# Altium schematic sheet MCU.SchDoc
size 420 x 297 mm; SheetNumber: 2; SheetTotal: 5
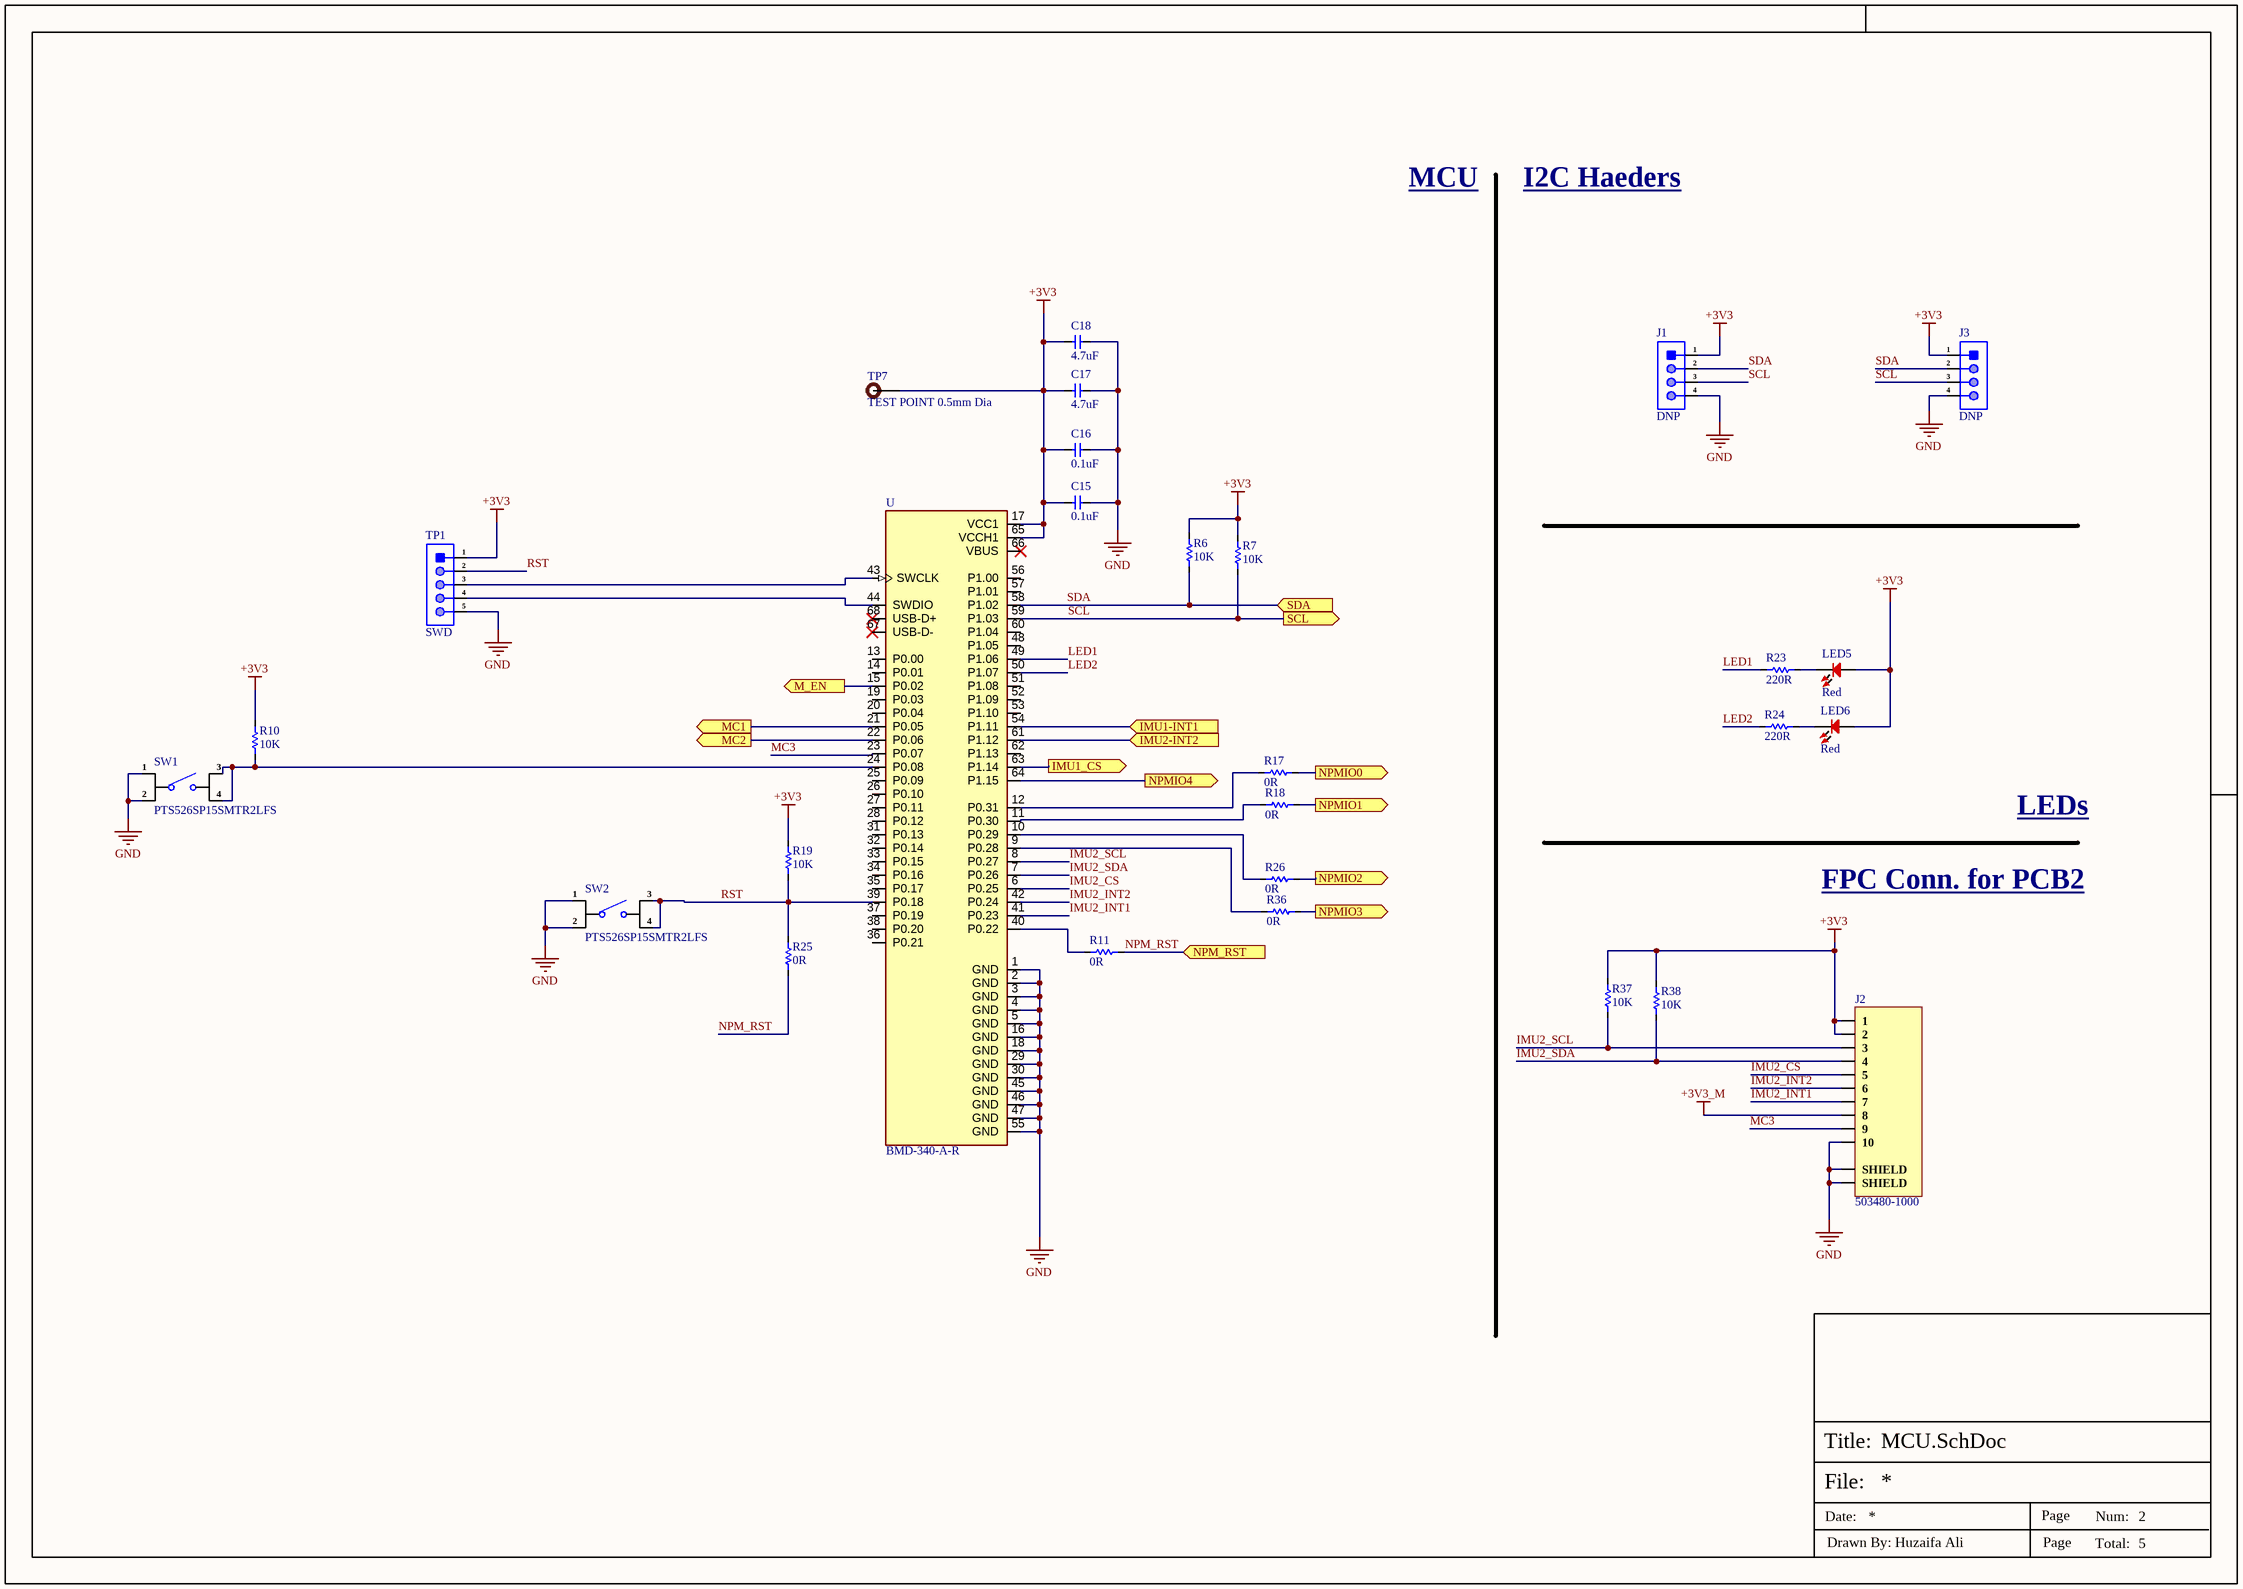
[diagram p0: MCU.SchDoc]

## Parts
C15  0.1uF  [Cap-0402]
C16  0.1uF  [Cap-0402]
C17  4.7uF  [Cap-0402]
C18  4.7uF  [Cap-0402]
J1  DNP  [4P Through Hole Pads]
J2  503480-1000  [5034801000]
J3  DNP  [4P Through Hole Pads]
LED5  Red  [LED-0402]
LED6  Red  [LED-0402]
R6  10K  [Res-0402]
R7  10K  [Res-0402]
R10  10K  [Res-0402]
R11  0R  [Res-0402]
R17  0R  [Res-0402]
R18  0R  [Res-0402]
R19  10K  [Res-0402]
R23  220R  [Res-0402]
R24  220R  [Res-0402]
R25  0R  [Res-0402]
R26  0R  [Res-0402]
R36  0R  [Res-0402]
R37  10K  [Res-0402]
R38  10K  [Res-0402]
SW1  PTS526SP15SMTR2LFS  [PTS526SP15SMTR2 LFS]
SW2  PTS526SP15SMTR2LFS  [PTS526SP15SMTR2 LFS]
TP1  SWD  [5 Test Pad]  (no BOM)
TP7  TEST POINT 0.5mm Dia  [Test-point - 0.5mm]  (no BOM)
U  BMD-340-A-R  [RIGADO_BMD-340-A-R]

## Ports
IMU1-INT1 (in, see IMU[5B]), IMU1_CS (out, see IMU[3C]), IMU2-INT2 (in, see IMU[5B]), M_EN (out, see Power_Management[3A]), MC1 (out, see Motor_Driver[2C]), MC2 (out, see Motor_Driver[4C]), NPM_RST (in, see Power_Management[3C]), NPMIO0 (out, see Power_Management[3C]), NPMIO1 (out, see Power_Management[3C]), NPMIO2 (out, see Power_Management[3C]), NPMIO3 (out, see Power_Management[3C]), NPMIO4 (out, see Power_Management[3C]), SCL (out, see IMU[3C], Power_Management[2D]), SDA (in, see IMU[3C], Power_Management[2D])

## Nets
+3V3: C15.2 C16.2 C17.2 C18.2 J1.1 J2.1 J2.2 J3.1 LED5.1 LED6.1 R6.2 R7.2 R10.2 R19.2 R37.2 R38.2 TP1.1 TP7.1 U.17(VCC1) U.65(VCCH1)
+3V3_M: J2.8
GND: C15.1 C16.1 C17.1 C18.1 J1.4 J2.10 J2.S1(SHIELD) J2.S2(SHIELD) J3.4 SW1.1 SW1.2 SW2.1 SW2.2 TP1.5 U.1(GND) U.2(GND) U.3(GND) U.4(GND) U.5(GND) U.16(GND) U.18(GND) U.29(GND) U.30(GND) U.45(GND) U.46(GND) U.47(GND) U.55(GND)
IMU1-INT1: U.54(P1.11) ; port IMU1-INT1
IMU1_CS: U.63(P1.14) ; port IMU1_CS
IMU2-INT2: U.61(P1.12) ; port IMU2-INT2
IMU2_CS: J2.5 U.6(P0.25)
IMU2_INT1: J2.7 U.41(P0.23)
IMU2_INT2: J2.6 U.42(P0.24)
IMU2_SCL: J2.3 R37.1 U.8(P0.27)
IMU2_SDA: J2.4 R38.1 U.7(P0.26)
LED1: R23.2 U.49(P1.06)
LED2: R24.2 U.50(P1.07)
M_EN: U.15(P0.02) ; port M_EN
MC1: U.21(P0.05) ; port MC1
MC2: U.22(P0.06) ; port MC2
MC3: J2.9 U.23(P0.07)
NPM_RST: R11.2 R25.1 ; port NPM_RST
NPMIO0: R17.2 ; port NPMIO0
NPMIO1: R18.2 ; port NPMIO1
NPMIO2: R26.2 ; port NPMIO2
NPMIO3: R36.2 ; port NPMIO3
NPMIO4: U.64(P1.15) ; port NPMIO4
RST: R19.1 R25.2 SW2.3 SW2.4 TP1.2 U.39(P0.18)
SCL: J1.3 J3.3 R7.1 U.59(P1.03) ; port SCL
SDA: J1.2 J3.2 R6.1 U.58(P1.02) ; port SDA
NetLED5_2: LED5.2 R23.1
NetLED6_2: LED6.2 R24.1
NetR10_1: R10.1 SW1.3 SW1.4 U.24(P0.08)
NetR11_1: R11.1 U.40(P0.22)
NetR17_1: R17.1 U.12(P0.31)
NetR18_1: R18.1 U.11(P0.30)
NetR26_1: R26.1 U.10(P0.29)
NetR36_1: R36.1 U.9(P0.28)
NetTP1_3: TP1.3 U.43(SWCLK)
NetTP1_4: TP1.4 U.44(SWDIO)

Not connected (* = marked no-connect by the designer): U 13(P0.00) 14(P0.01) 19(P0.03) 20(P0.04) 25(P0.09) 26(P0.10) 27(P0.11) 28(P0.12) 31(P0.13) 32(P0.14) 33(P0.15) 34(P0.16) 35(P0.17) 36(P0.21) 37(P0.19) 38(P0.20) 48(P1.05) 51(P1.08) 52(P1.09) 53(P1.10) 56(P1.00) 57(P1.01) 60(P1.04) 62(P1.13) 66(VBUS)* 67(USB-D-)* 68(USB-D+)*

## Notes on the sheet
- MCU
- I2C Haeders
- LEDs
- FPC Conn. for PCB2
- File:
- Title:
- Date:
- Page
- Num:
- Total:
- Drawn By: Huzaifa Ali

## Library data of the parts
C15 C16 = C1005X5R1H104K050BB: CAP CER 0.1UF 50V X5R 0402; Manufacturer: TDK; Dielectric Material: Ceramic; Capacitance: 100nF; Tolerance: 10%; Item Type: Capacitor; Supplier 1: Digi-Key; Manufacturer Part Number: C1005X5R1H104K050BB; Stock 1: 1455182; Pricing 1: 1=0.12, 10=0.09, 50=0.049, 100=0.04, 500=0.02858, 1000=0.02245, 2500=0.02041, 5000=0.01878 (USD); Mount: Surface Mount; Case/Package: 0402; Case Code (Metric): 1005; Case Code (Imperial): 0402; Weight: 2.3E-05oz; Min Operating Temperature: -55°C; Max Operating Temperature: 85°C; Dielectric: X5R; Voltage Rating: 50V; Packaging: Tape and Reel; Voltage Rating (DC): 50V; Termination: SMD/SMT; Construction: Flat; Package Quantity: 1; Resistor Type: Ceramic; Voltage: 50V; Series: C; Length: 1mm; Width: 0.02inch; Height: 0.5mm; Depth: 0.5mm; Thickness: 0.022inch; Radiation Hardening: No; Lead Free: Lead Free; REACH SVHC: No SVHC; RoHS Compliant: Yes; ComponentLink1URL: https://product.tdk.com/info/en/catalog/spec/mlccspec_commercial_general_midvoltage_en.pdf?src-supplier=Digi-Key; ComponentLink1Description: https://product.tdk.com/info/en/catalog/spec/mlccspec_commercial_general_midvoltage_en.pdf?src-supplier=Digi-Key; ComponentLink2URL: http://www.tdk.co.jp/tefe02/e413_c.pdf?src-supplier=Future+Electronics; ComponentLink2Description: http://www.tdk.co.jp/tefe02/e413_c.pdf?src-supplier=Future+Electronics; ComponentLink3URL: https://www.verical.com/server-webapp/html/getDatasheet?partID=743571&src-supplier=Verical; ComponentLink3Description: https://www.verical.com/server-webapp/html/getDatasheet?partID=743571&src-supplier=Verical; ComponentLink4URL: http://www.tdk.co.jp/tefe02/e412_c.pdf?src-supplier=Avnet+Europe; ComponentLink4Description: http://www.tdk.co.jp/tefe02/e412_c.pdf?src-supplier=Avnet+Europe; Supplier Part Number 1: 445-5942-1-ND; LCSC Part Number: C2181865
C17 C18 = CL05A475MO5NUNC: CAP CER 4.7UF 16V X5R 0402; Manufacturer: Samsung; Material: 4241ConductorMaterial; Tolerance: 20%; Supplier 1: Avnet; Manufacturer Part Number: CL05A475MO5NUNC; RoHS: Yes; Category: Ceramic Capacitors; Stock 1: 50000; Pricing 1: 10000=0.09712 (USD); Mount: Surface Mount; Case/Package: 0402; Case Code (Metric): 1005; Case Code (Imperial): 0402; Min Operating Temperature: -55°C; Max Operating Temperature: 85°C; Packaging: Cut Tape; Capacitance: 4.7uF; Voltage Rating: 16V; Series: CL; Voltage Rating (DC): 16V; Length: 0.039inch; Width: 0.02inch; Height: 550um; Thickness: 0.022inch; RoHS Compliant: Yes; ComponentLink1URL: http://www.farnell.com/datasheets/2710653.pdf?src-supplier=Farnell; ComponentLink1Description: http://www.farnell.com/datasheets/2710653.pdf?src-supplier=Farnell; ComponentLink2URL: http://www.samsungsem.com/kr/support/product-search/mlcc/CL05A475MO5NUNC.jsp?src-supplier=Digikey; ComponentLink2Description: http://www.samsungsem.com/kr/support/product-search/mlcc/CL05A475MO5NUNC.jsp?src-supplier=Digikey; ComponentLink3URL: http://www.farnell.com/datasheets/2710653.pdf?src-supplier=Element14; ComponentLink3Description: http://www.farnell.com/datasheets/2710653.pdf?src-supplier=Element14; ComponentLink4URL: https://datasheet.octopart.com/CL05A475MO5NUNC-Samsung-Electro-Mechanics-datasheet-123102911.pdf?src-supplier=Future+Electronics; ComponentLink4Description: https://datasheet.octopart.com/CL05A475MO5NUNC-Samsung-Electro-Mechanics-datasheet-123102911.pdf?src-supplier=Future+Electronics; ComponentLink5URL: http://www.farnell.com/datasheets/2710653.pdf?src-supplier=Newark; ComponentLink5Description: http://www.farnell.com/datasheets/2710653.pdf?src-supplier=Newark; Supplier Part Number 1: CL05A475MO5NUNC
J1 J3 = 4P Through Hole Pads: Wire Connecting Pads; Manufacturer Part Number: 4P Through Hole Pads; Item Type: Through Hole Pads
J2 = 503480-1000: CONN FFC FPC 10POS 0.5MM R/A; Manufacturer: Molex; Item Type: FFC / FPC; Actuator Material: Nylon,Glass,Polyamide; Actuator Color: Black; Plating: 157ConductorMaterial; Voltage Rating (AC): 50V; Current Rating: 500mA; Number of Positions: 10; Gender: Receptacle; Wire/Cable Type: Straight; Stackable: No; Supplier: Mouser; Supplier Part Number: 538-503480-1000; Manufacturer Part Number: 503480-1000; RoHS: Yes; Stock: 11378; Pricing: 1=0.99, 10=0.737, 50=0.737, 100=0.64, 1000=0.559, 10000=0.465 (USD); Housing Color: White; Housing Material: Polymer; Material: 150ConductorMaterial; Contact Material: Bronze; Contact Plating: Gold; Min Operating Temperature: -40°C; Max Operating Temperature: 85°C; Package Quantity: 3000; Number of Rows: 1; Voltage Rating: 50V; Packaging: Tape and Reel; Termination: Solder; Max Voltage Rating (AC): 50V; Number of Contacts: 10; Max Voltage Rating (DC): 50V; Orientation: Right Angle; Series: BackFlip, Easy-On 503480; Number of Circuits: 10; Mating Cycles: 10; Length: 6.7mm; Pitch: 0.5mm; Depth: 3.6mm; Radiation Hardening: No; Flammability Rating: UL94 V-0; Reach SVHC Compliant: Unknown; Halogen Free: 5696HalogenFree; ELV: 5681ELVCompliant; ComponentLink1URL: https://datasheet.ciiva.com/26916/getdatasheetpartid-735332-26916946.pdf?src-supplier=Verical; ComponentLink1Description: https://datasheet.ciiva.com/26916/getdatasheetpartid-735332-26916946.pdf?src-supplier=Verical; ComponentLink2URL: https://datasheet.ciiva.com/5137/5034801000-ffc-fpc-connectors-179433-5137762.pdf?src-supplier=Mouser; ComponentLink2Description: https://datasheet.ciiva.com/5137/5034801000-ffc-fpc-connectors-179433-5137762.pdf?src-supplier=Mouser; ComponentLink3URL: https://datasheet.ciiva.com/671/5034801000-sd-671179.pdf?src-supplier=Digikey; ComponentLink3Description: https://datasheet.ciiva.com/671/5034801000-sd-671179.pdf?src-supplier=Digikey
LED5 LED6 = XZMDK68W-2: LED RED CLEAR CHIP SMD; Manufacturer: SunLED; Lens Color: Colorless; Luminous Intensity: 69mcd; Test Current: 20mA; Viewing Angle: 120°; Dominant Wavelength: 630nm; Forward Voltage: 1.95V; Supplier 1: Digi-Key; Manufacturer Part Number: XZMDK68W-2; Stock 1: 69539; Pricing 1: 1=0.43, 10=0.306, 100=0.136, 500=0.0952, 1000=0.0782 (USD); Mount: Surface Mount; Case/Package: 0402; Color: Red; Case Code (Metric): 1005; Case Code (Imperial): 0402; Packaging: Tape and Reel; Lens Transparency: Clear; Length: 1mm; Height: 0.6mm; Width: 0.5mm; ComponentLink1URL: http://www.sunledusa.com/products/spec/XZMDK68W-2.pdf?src-supplier=Digi-Key; ComponentLink1Description: http://www.sunledusa.com/products/spec/XZMDK68W-2.pdf?src-supplier=Digi-Key; ComponentLink2URL: https://www.sunledusa.com/products/spec/XZMDK68W-2.pdf?src-supplier=Digi-Key; ComponentLink2Description: https://www.sunledusa.com/products/spec/XZMDK68W-2.pdf?src-supplier=Digi-Key; Supplier Part Number 1: 1497-1174-6-ND; Item Type: LED
R6 R7 R10 R19 R37 R38 = RC0402FR-0710KL: RES 10K OHM 1% 1/16W 0402; Manufacturer: Yageo; Resistance: 10kR; Voltage Rating (DC): 50V; Temperature Coefficient: 100ppm/°C; Power Rating: 62.5mW; Max Power Dissipation: 63mW; Item Type: Resistor; Supplier 1: Mouser; Manufacturer Part Number: RC0402FR-0710KL; RoHS: Yes; Category: Chip SMD Resistors; Stock 1: 18648329; Pricing 1: 1=0.10000, 10=0.01400, 50=0.01400, 100=0.00500, 1000=0.00300, 10000=0.00200 (USD); Case/Package: 0402; Number of Pins: 2; Case Code (Imperial): 0402; Case Code (Metric): 1005; Min Operating Temperature: -55°C; Max Operating Temperature: 155°C; Resistor Type: Thick Film; Tolerance: 1%; Packaging: Tape and Reel; Voltage Rating: 50V; Termination: SMD/SMT; Working Voltage: 50V; Number of Terminations: 2; Features: Moisture Resistant; Series: RC; Resistance Tolerance: 1%; Construction: Rectangular; Length: 1mm; Width: 0.5mm; Height: 0.32mm; Depth: 0.5mm; Lead Pitch: 0.2mm; REACH SVHC: No SVHC; Lead Free: Lead Free; RoHS Compliant: Yes; Military Standard: Not; ComponentLink1URL: https://datasheet.ciiva.com/7660/38568-7660787.pdf?src-supplier=Element14; ComponentLink1Description: https://datasheet.ciiva.com/7660/38568-7660787.pdf?src-supplier=Element14; ComponentLink2URL: https://datasheet.ciiva.com/7849/1686128-7849814.pdf?src-supplier=Element14; ComponentLink2Description: https://datasheet.ciiva.com/7849/1686128-7849814.pdf?src-supplier=Element14; ComponentLink3URL: https://datasheet.ciiva.com/7983/1018594-7983486.pdf?src-supplier=Element14; ComponentLink3Description: https://datasheet.ciiva.com/7983/1018594-7983486.pdf?src-supplier=Element14; ComponentLink4URL: https://datasheet.ciiva.com/22747/1018594-22747512.pdf?src-supplier=Element14; ComponentLink4Description: https://datasheet.ciiva.com/22747/1018594-22747512.pdf?src-supplier=Element14; ComponentLink5URL: https://datasheet.ciiva.com/12667/pyu-rc0402-51-rohs-l-6-r-12667067.pdf?src-supplier=Mouser; ComponentLink5Description: https://datasheet.ciiva.com/12667/pyu-rc0402-51-rohs-l-6-r-12667067.pdf?src-supplier=Mouser; ComponentLink6URL: https://datasheet.ciiva.com/7849/1784430-7849813.pdf?src-supplier=Element14; ComponentLink6Description: https://datasheet.ciiva.com/7849/1784430-7849813.pdf?src-supplier=Element14; ComponentLink7URL: https://datasheet.ciiva.com/7849/1784430-7849815.pdf?src-supplier=Element14; ComponentLink7Description: https://datasheet.ciiva.com/7849/1784430-7849815.pdf?src-supplier=Element14; Supplier Part Number 1: 603-RC0402FR-0710KL; LCSC Part Number: C60490
R11 R17 R18 R25 R26 R36 = RC0402FR-070RL: RES 0 OHM JUMPER 1/16W 0402; Manufacturer: Yageo; Item Type: Resistors; Tolerance: 1%; Power Rating: 62.5mW; Voltage Rating: 50V; Temperature Coefficient: 200ppm/°C; Max Power Dissipation: 63mW; Supplier 1: Mouser; Manufacturer Part Number: RC0402FR-070RL; RoHS: Yes; Stock 1: 8556842; Pricing 1: 1=0.10000, 10=0.01400, 50=0.01400, 100=0.00600, 1000=0.00300, 5000=0.00200, 10000=0.00100 (USD); Mount: Surface Mount; Case/Package: 0402; Contact Plating: Tin,Matte; Case Code (Imperial): 0402; Case Code (Metric): 1005; Size Code: 0402; Min Operating Temperature: -55°C; Max Operating Temperature: 155°C; Resistance: 0R; Resistor Type: Thick Film; Packaging: Tape and Reel; Termination: SMD/SMT; Features: Moisture Resistant; Series: RC; Number of Terminations: 2; Length: 1mm; Width: 0.5mm; Height: 0.35mm; Radiation Hardening: No; Lead Free: Lead Free; RoHS Compliant: Yes; ComponentLink1URL: https://datasheet.ciiva.com/8896/pyu-rc0402-51-rohs-l-6-8896149.pdf?src-supplier=Avnet; ComponentLink1Description: https://datasheet.ciiva.com/8896/pyu-rc0402-51-rohs-l-6-8896149.pdf?src-supplier=Avnet; ComponentLink2URL: https://datasheet.ciiva.com/16790/pyu-rc0402-51-rohs-l-6-r-16790444.pdf?src-supplier=Future+Electronics; ComponentLink2Description: https://datasheet.ciiva.com/16790/pyu-rc0402-51-rohs-l-6-r-16790444.pdf?src-supplier=Future+Electronics; Supplier Part Number 1: 603-RC0402FR-070RL; LCSC Part Number: C106231
R23 R24 = RC0402FR-07220RL: RES 220 OHM 1% 1/16W 0402; Manufacturer: Yageo; Item Type: Resistors; Power Rating: 62.5mW; Voltage Rating: 50V; Temperature Coefficient: 100ppm/°C; Max Power Dissipation: 63mW; Supplier: Digikey; LCSC Part Number: C112291; Manufacturer Part Number: RC0402FR-07220RL; RoHS: Yes; Stock: 225544; Pricing: 1=0.1, 10=0.007, 100=0.0061, 1000=0.0051, 2500=0.00408 (USD); Case/Package: 0402; Pins: 2; Case Code (Imperial): 0402; Case Code (Metric): 1005; Min Operating Temperature: -55°C; Max Operating Temperature: 155°C; Value: 220R; Tolerance: 1%; Packaging: Tape and Reel; Voltage Rating (DC): 50V; Package Quantity: 1; Termination: SMD/SMT; Resistor Type: Thick Film; Number of Terminations: 2; Features: Moisture Resistant; Series: RC; Resistance Tolerance: 1%; Construction: Rectangular; Technology: THICK FILM; Voltage Rating (AC): 50V; Length: 0.039inch; Width: 0.02inch; Height: 0.016inch; Depth: 0.5mm; Reach SVHC Compliant: No; Military Standard: Not; RoHS Compliant: Yes; Lead Free: 5697LeadFree; ComponentLink1URL: https://datasheet.ciiva.com/2453/pyu-r-int-thick-7-2453461.pdf?src-supplier=Digikey; ComponentLink1Description: https://datasheet.ciiva.com/2453/pyu-r-int-thick-7-2453461.pdf?src-supplier=Digikey
SW1 SW2 = PTS526SP15SMTR2LFS: Tactile Switches 5.20 x 5.20 Tact Switch for SMT; Manufacturer: ITT C&K; Supplier: Mouser; LCSC Part Number: C2991193; Manufacturer Part Number: PTS526SP15SMTR2LFS; RoHS: No; Item Type: Switch; Stock: 8224; Pricing: 1=0.14, 10=0.135, 50=0.135, 100=0.12, 1000=0.12, 10000=0.102 (USD)
TP1 = 5 Test Pad: Wire Connecting Pad; Item Type: Test Point; Manufacturer Part Number: 5 Test Pad
TP7 = TEST POINT 0.5mm Dia: Test Point ON; Item Type: Test Point; Manufacturer Part Number: TEST POINT 0.5mm Dia
U = BMD-340-A-R: 802.15.4, Bluetooth Bluetooth v5.0, Thread, ZigbeeÂ® Transceiver Module 2.36GHz ~ 2.5GHz Integrated, Trace Surface Mount; MF: U-Blox America; Value: *; Availability: Unavailable; Package: Module Rigado; Price: None; SnapEDA_Link: https://www.snapeda.com/parts/BMD-340-A-R/U-Blox%20America%20Inc./view-part/2079913/?ref=snap; MP: BMD-340-A-R